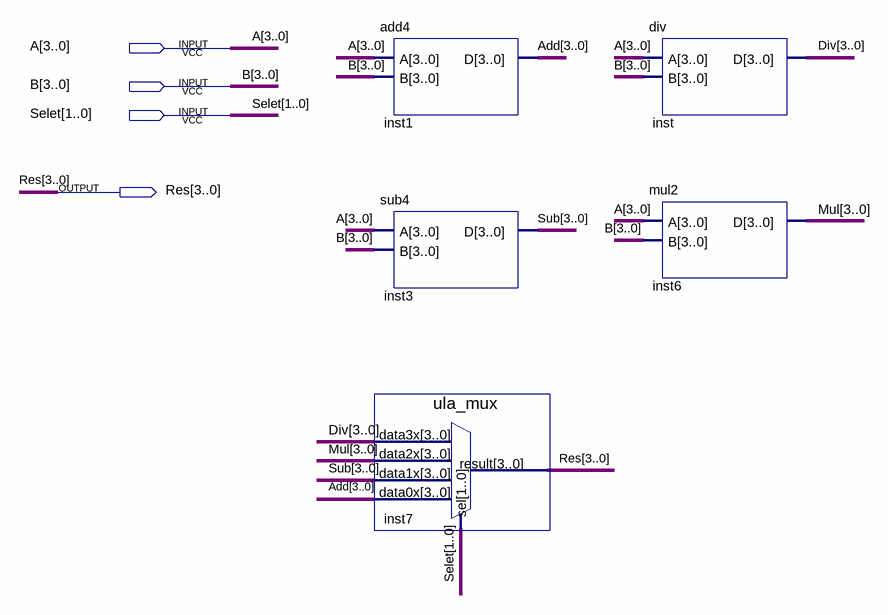
[diagram p0: schematic sheet]
// Quartus schematic ULA.bdf as structural Verilog: 5 symbols, 4 pins
module ULA (
  input  [3:0] A,
  input  [3:0] B,
  input  [1:0] Selet,
  output [3:0] Res
);

  wire [3:0] Add, Div, Mul, Sub;

  add4 inst1 (.A(A), .B(B), .D(Add));
  sub4 inst3 (.A(A), .B(B), .D(Sub));
  ula_mux inst7 (.data3x(Div), .data2x(Mul), .data1x(Sub), .data0x(Add), .sel(Selet), .result(Res));
  div inst (.A(A), .B(B), .D(Div));
  mul2 inst6 (.A(A), .B(B), .D(Mul));
endmodule
